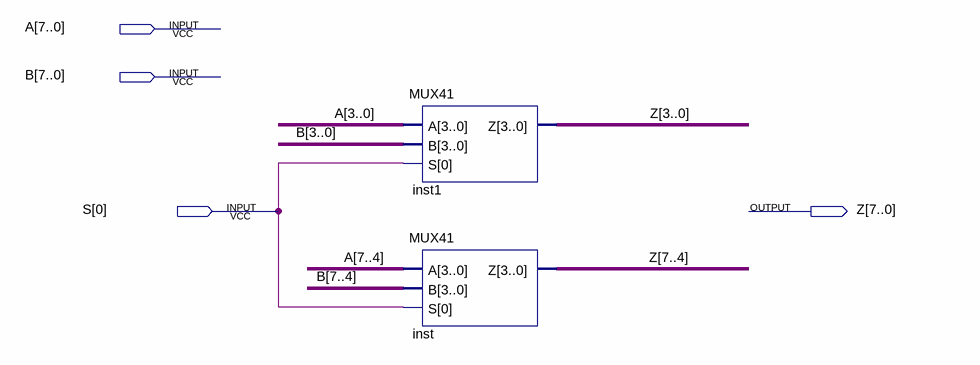
[diagram p0: schematic sheet]
// Quartus schematic MUX81.bdf as structural Verilog: 2 symbols, 4 pins
module MUX81 (
  input  [7:0] A,
  input  [7:0] B,
  input  [0:0] S,
  output [7:0] Z
);

  MUX41 inst1 (.A(A[3:0]), .B(B[3:0]), .S(S[0]), .Z(Z[3:0]));
  MUX41 inst (.A(A[7:4]), .B(B[7:4]), .S(S[0]), .Z(Z[7:4]));
endmodule
